# Altium schematic sheet Connector_Section.SchDoc
size A4; DocumentNumber: 5; SheetNumber: 5; SheetTotal: 5
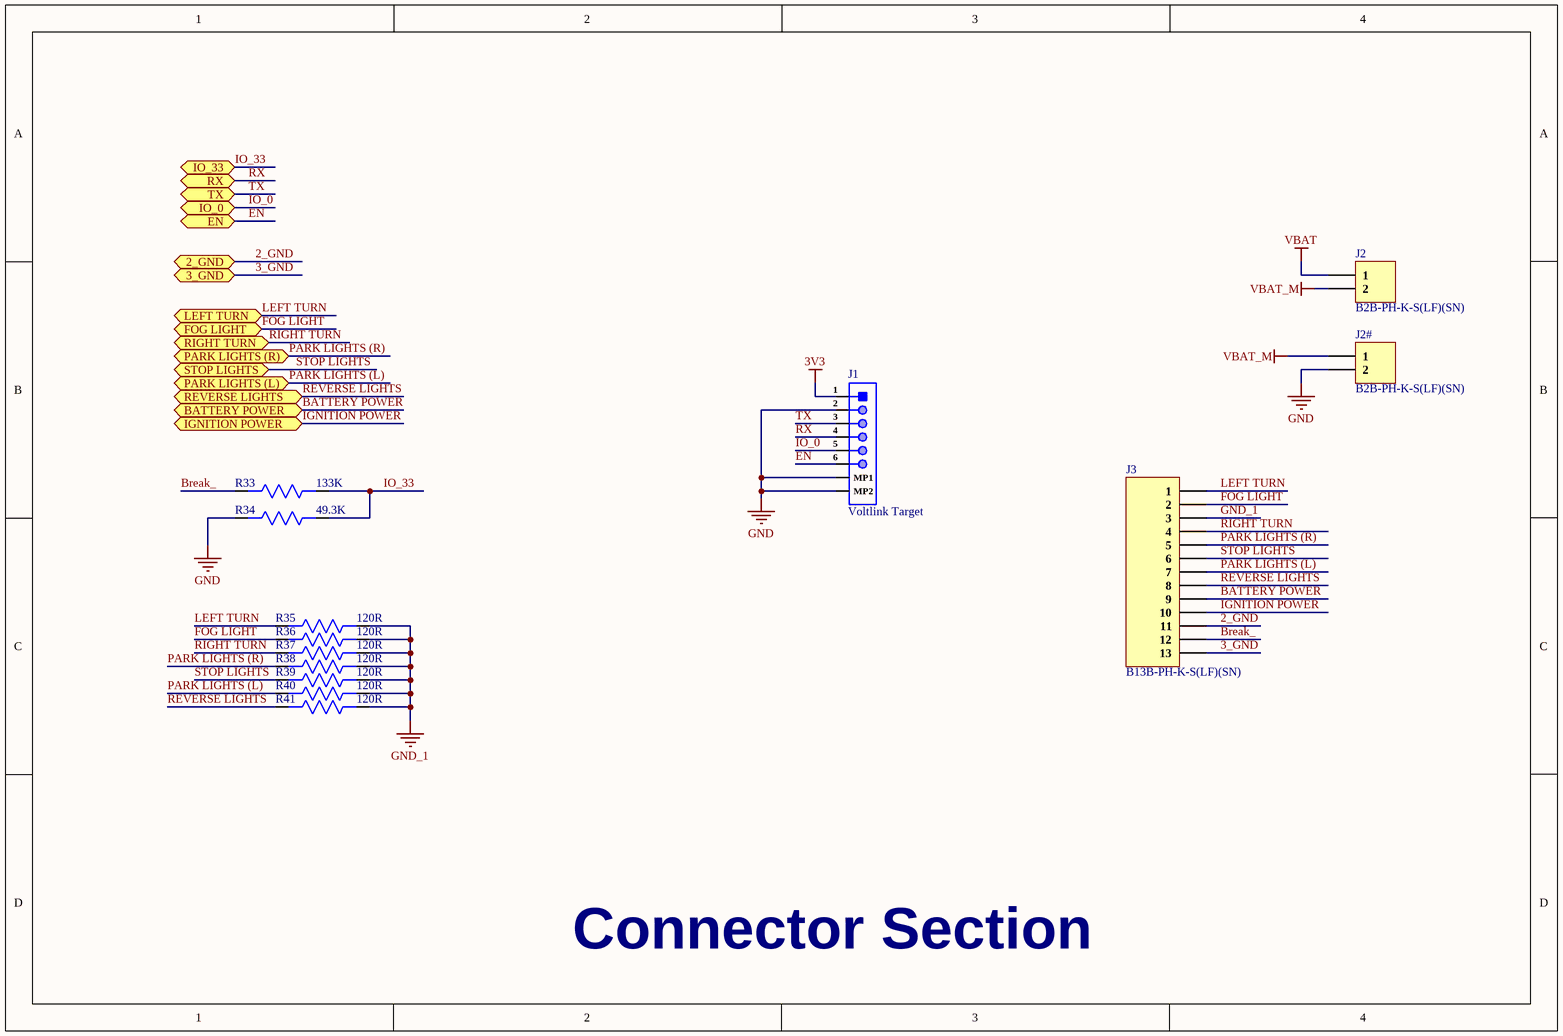
[diagram p0: Connector_Section.SchDoc]

## Parts
J1  Voltlink Target  [Voltlink Target]
J2  B2B-PH-K-S(LF)(SN)  [B2B-PH-K-S(LF)(SN)]
J2#  B2B-PH-K-S(LF)(SN)  [B2B-PH-K-S(LF)(SN)]
J3  B13B-PH-K-S(LF)(SN)  [B13B-PH-K-S(LF)(SN)]
R33  133K  [Res0603]
R34  49.3K  [Res0603]
R35  120R  [Res2512]
R36  120R  [Res2512]
R37  120R  [Res2512]
R38  120R  [Res2512]
R39  120R  [Res2512]
R40  120R  [Res2512]
R41  120R  [Res2512]

## Ports
2_GND (bidir), 3_GND (bidir), BATTERY POWER (bidir), EN (bidir), FOG LIGHT (bidir), IGNITION POWER (bidir), IO_0 (bidir), IO_33 (bidir), LEFT TURN (bidir), PARK LIGHTS (L) (bidir), PARK LIGHTS (R) (bidir), REVERSE LIGHTS (bidir), RIGHT TURN (bidir), RX (bidir), STOP LIGHTS (bidir), TX (bidir)

## Nets
3V3: J1.1
GND: J1.2 J1.MP1 J1.MP2 J2#.2 R34.2
GND_1: J3.3 R35.1 R36.1 R37.1 R38.1 R39.1 R40.1 R41.1
VBAT: J2.1
VBAT_M: J2.2 J2#.1
2_GND: J3.11 ; port 2_GND
3_GND: J3.13 ; port 3_GND
BATTERY POWER: J3.9 ; port BATTERY POWER
Break_: J3.12 R33.2
EN: J1.6 ; port EN
FOG LIGHT: J3.2 R36.2 ; port FOG LIGHT
IGNITION POWER: J3.10 ; port IGNITION POWER
IO_0: J1.5 ; port IO_0
IO_33: R33.1 R34.1 ; port IO_33
LEFT TURN: J3.1 R35.2 ; port LEFT TURN
PARK LIGHTS (L): J3.7 R40.2 ; port PARK LIGHTS (L)
PARK LIGHTS (R): J3.5 R38.2 ; port PARK LIGHTS (R)
REVERSE LIGHTS: J3.8 R41.2 ; port REVERSE LIGHTS
RIGHT TURN: J3.4 R37.2 ; port RIGHT TURN
RX: J1.4 ; port RX
STOP LIGHTS: J3.6 R39.2 ; port STOP LIGHTS
TX: J1.3 ; port TX

## Notes on the sheet
- Connector Section

## Library data of the parts
J1 = C145963: 1x6P SH 1 1mm 6 SMD,P=1mm Wire To Board / Wire To Wire Connector ROHS; Manufacturer: BOOMELE; Manufacturer Part Number: C145963; Package: SMD,P=1mm; LCSC Part Number: C145963; Item Type: Connector; ComponentLink1Description: LCSC; ComponentLink1URL: https://www.lcsc.com/product-detail/Wire-To-Board-Wire-To-Wire-Connector_BOOMELE-Boom-Precision-Elec-C145963_C145963.html
J2 J2# = B2B-PH-K-S(LF)(SN): CONN HEADER VERT 2POS 2MM; Manufacturer: JST; Supplier 1: Digi-Key; Manufacturer Part Number: B2B-PH-K-S(LF)(SN); Stock 1: 36331; Pricing 1: 1=0.17, 10=0.162, 100=0.1002, 500=0.08288, 1000=0.07252, 5000=0.06216, 10000=0.06044 (USD); Weight: 0.0625lb; Length: 0.2inch; Height: 0.35inch; Width: 0.24inch; Supplier Part Number 1: 455-1704-ND
J3 = B13B-PH-K-S(LF)(SN): CONN HEADER VERT 13POS 2MM; Manufacturer: JST; Current Rating: 2A; Number of Positions: 13; Gender: Male; Connector Type: Male Pin; Pitch: 0.079inch; Supplier 1: Digi-Key; Manufacturer Part Number: B13B-PH-K-S(LF)(SN); Stock 1: 5302; Pricing 1: 1=0.59, 10=0.549, 100=0.4206, 500=0.36574, 1000=0.30173, 5000=0.26516, 10000=0.24687 (USD); Mount: Through Hole; Contact Material: Tin; Color: Natural; Contact Plating: Tin; Housing Color: Natural; Number of Rows: 1; Packaging: Bulk; Termination: Press-Fit; Fastening Type: Detent; Number of Contacts: 13; Length: 27.9mm; Height: 9.4mm; Width: 4.5mm; Contact Mating Length: 0.13inch; Lead Free: Lead Free; Supplier Part Number 1: 455-1715-ND
R33 = RC0603FR-07133KL: RES SMD 133K OHM 1% 1/10W 0603; Manufacturer: Yageo; Resistance: 133kR; Power Rating: 100mW; Voltage Rating: 50V; Temperature Coefficient: 100ppm/°C; Supplier 1: Digi-Key; Manufacturer Part Number: RC0603FR-07133KL; Stock 1: 1119965; Pricing 1: 1=0.1, 10=0.024, 100=0.0097, 1000=0.00437, 2500=0.00379 (USD); Case/Package: 0603; Case Code (Metric): 1608; Case Code (Imperial): 0603; Min Operating Temperature: -55°C; Max Operating Temperature: 155°C; Tolerance: 1%; Package Quantity: 1; Packaging: Tape and Reel; Composition: Thick Film; Number of Terminations: 2; Termination: SMD/SMT; Military Standard: Not; Max Power Dissipation: 100mW; Voltage Rating (DC): 50V; Features: Moisture Resistant; Length: 1.6mm; Height: 0.022inch; Width: 0.031inch; Depth: 0.8mm; Lead Free: Lead Free; ComponentLink1URL: http://www.yageo.com/documents/recent/PYu-RC_Group_51_RoHS_L_10.pdf?src-supplier=Digi-Key; ComponentLink1Description: http://www.yageo.com/documents/recent/PYu-RC_Group_51_RoHS_L_10.pdf?src-supplier=Digi-Key; ComponentLink2URL: http://www.yageo.com/documents/recent/PYu-RC_Group_51_RoHS_L_9.pdf?src-supplier=Digi-Key; ComponentLink2Description: http://www.yageo.com/documents/recent/PYu-RC_Group_51_RoHS_L_9.pdf?src-supplier=Digi-Key; ComponentLink3URL: http://www.mouser.com/catalog/specsheets/RC0603.pdf?src-supplier=Mouser; ComponentLink3Description: http://www.mouser.com/catalog/specsheets/RC0603.pdf?src-supplier=Mouser; Supplier Part Number 1: 311-133KHRCT-ND
R34 = RT0603DRE0749K3L: Thin Film Resistors - SMD 1/10W 49.3K Ohms .5%; Manufacturer: Yageo; Resistance: 49.3kR; Tolerance: 0.5%; Supplier 1: Mouser; Manufacturer Part Number: RT0603DRE0749K3L; Stock 1: 12765; Pricing 1: 1=0.16, 10=0.09, 50=0.09, 100=0.03, 1000=0.03, 10000=0.02 (USD); Case/Package: 0603; Supplier Part Number 1: 603-RT0603DRE0749K3L
R35-R41 = 3522120RJT: RES SMD 120 OHM 5% 3W 2512; Manufacturer: TE Connectivity CGS; Voltage Rating: 250V; Number of Resistors: 1; Temperature Coefficient: 100ppm/°C; Supplier 1: Digi-Key; Manufacturer Part Number: 3522120RJT; Stock 1: 33369; Pricing 1: 1=0.65, 10=0.541, 100=0.3634, 1000=0.21265 (USD); Mount: Surface Mount; Case/Package: 2512; Case Code (Metric): 6432; Case Code (Imperial): 2512; Min Operating Temperature: -55°C; Max Operating Temperature: 105°C; Resistance: 120R; Power Rating: 3W; Packaging: Tape and Reel; Composition: Power resistor,Thick Film; Termination: Solder; Tolerance: 5%; Voltage Rating (DC): 250V; Number of Terminations: 2; Length: 6.35mm; Height: 1.1mm; Depth: 3.2mm; REACH SVHC: Unknown; Supplier Part Number 1: A121132CT-ND